# Altium schematic sheet Salve.SchDoc
size A; SheetNumber: 1; SheetTotal: 1
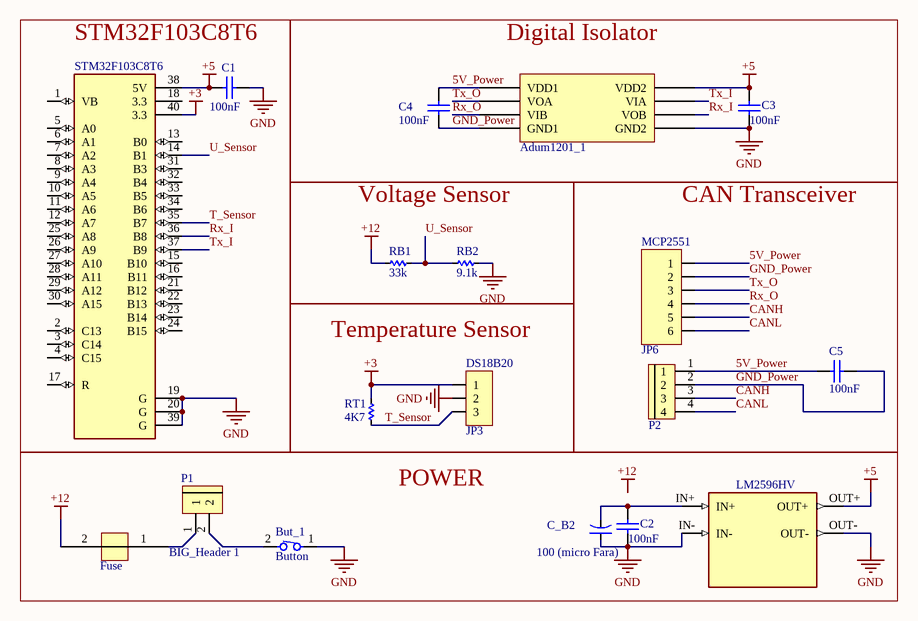
[diagram p0: Salve.SchDoc]

## Parts
*  Fuse  [fuse]
*1  Adum1201_1  [Adum1201]
But_1  Button  [Button]
C1  value 100nF  [Tu-ceramic]  (hidden comment: Capacitor Ceramic)
C2  value 100nF  [Tu-ceramic]  (hidden comment: Capacitor Ceramic)
C3  value 100nF  [Tu-ceramic]  (hidden comment: Capacitor Ceramic)
C4  value 100nF  [Tu-ceramic]  (hidden comment: Capacitor Ceramic)
C5  value 100nF  [Tu-ceramic]  (hidden comment: Capacitor Ceramic)
C_B2  100 (micro Fara)  [CA-ALU-2.54]
DS18B20  JP3  [JP3-C1T]
MCP2551  JP6  [JP6-C1T]
P1  BIG_Header 1  [BIG_Header 2]
P2  BIG Header 4  [BIG_Header 4]  (value not drawn)
PS1  LM2596HV  [CONV_MC00100]
RB1  33k  [RES-1/2W]
RB2  9.1k  [RES-1/2W]
RT1  4K7  [RES-1/2W]
STM32F103C8T6  ZC323000  [MODULE_ZC323000]  (value not drawn)

## Blocks framed on the sheet
STM32F103C8T6: C1 STM32F103C8T6
Digital Isolator: *1 C3 C4
Voltage Sensor: RB1 RB2
CAN Transceiver: C5 MCP2551 P2
Temperature Sensor: DS18B20 RT1
POWER: * But_1 C2 C_B2 P1 PS1

## Nets
+3: DS18B20.1 RT1.1 STM32F103C8T6.40(3.3)
+5: *1.5(VDD2) C1.1 C3.1 PS1.OUT+ STM32F103C8T6.38(5V)
+12: *.2 RB1.2
GND: *1.8(GND2) But_1.1 C1.2 C2.2 C3.2 C_B2.1 DS18B20.2 PS1.IN- PS1.OUT- RB2.1 STM32F103C8T6.19(G) STM32F103C8T6.20(G) STM32F103C8T6.39(G)
5V_Power: *1.1(VDD1) C4.1 C5.1 MCP2551.1 P2.1
CANH: MCP2551.5 P2.3
CANL: MCP2551.6 P2.4
GND_Power: *1.4(GND1) C4.2 C5.2 MCP2551.2 P2.2
Rx_I: *1.7(VOB) STM32F103C8T6.36(B8)
Rx_O: *1.3(VIB) MCP2551.4
T_Sensor: DS18B20.3 RT1.2 STM32F103C8T6.35(B7)
Tx_I: *1.6(VIA) STM32F103C8T6.37(B9)
Tx_O: *1.2(VOA) MCP2551.3
U_Sensor: RB1.1 RB2.2 STM32F103C8T6.14(B1)
Net*_1: *.1 P1.1
NetBut_1_2: But_1.2 P1.2
NetC2_1: C2.1 C_B2.2 PS1.IN+

Not connected (* = marked no-connect by the designer): STM32F103C8T6 1(VB) 2(C13) 3(C14) 4(C15) 5(A0) 6(A1) 7(A2) 8(A3) 9(A4) 10(A5) 11(A6) 12(A7) 13(B0) 15(B10) 16(B11) 17(R) 18(3.3) 21(B12) 22(B13) 23(B14) 24(B15) 25(A8) 26(A9) 27(A10) 28(A11) 29(A12) 30(A15) 31(B3) 32(B4) 33(B5) 34(B6)

## Notes on the sheet
- Labels drawn without touching a wire or pin: +12

## Library data of the parts
* = Component_1
*1 = Adum1201_?
C1-C5 = CapDecop: Capacitor; Published: 8-Jun-2000; LatestRevisionDate: 17-Jul-2002; LatestRevisionNote: Re-released for DXP Platform.; PackageReference: RAD-0.3; Publisher: Altium Limited
C_B2 = CN-ALU-DIP: Capacitor (Semiconductor SIM Model); Value: 104; LatestRevisionDate: 17-Jul-2002; LatestRevisionNote: Re-released for DXP Platform.; PackageReference: C1206; Publisher: Altium Limited
DS18B20 = JP3: WR-PHD 2.54 mm Angled Socket Header; Manufacturer: W¨¹rth Elektronik eiSos GmbH; partNo: 613003143121; ComponentLink1 Description: Manufacturer; ComponentLink2 Description: Datasheet; NoPins: 03; Created Date: 29 March 2013; ComponentLink1URL: http://www.we-online.com; ComponentLink2URL: http://katalog.we-online.de/em/datasheet/6130xx143121.pdf; Created by: Karrer Zheng
MCP2551 = JP6: WR-PHD 2.54 mm Angled Socket Header; Manufacturer: W¨¹rth Elektronik eiSos GmbH; partNo: 613006143121; ComponentLink1 Description: Manufacturer; ComponentLink2 Description: Datasheet; NoPins: 06; Created Date: 29 March 2013; ComponentLink1URL: http://www.we-online.com; ComponentLink2URL: http://katalog.we-online.de/em/datasheet/6130xx143121.pdf; Created by: Karrer Zheng
P1 = BIG_Header 2
P2 = BIG_Header 4
PS1 = MC00100: DC-DC LM2596 Step Down Adjustable Converter Power Supply Module 1.3V-35V; MF: YKS; SnapEDA_Link: https://www.snapeda.com/parts/MC00100/YKS/view-part/?ref=snap; Package: None; Value: *; MP: MC00100; Check_prices: https://www.snapeda.com/parts/MC00100/YKS/view-part/?ref=eda
RB1 RB2 RT1 = Res: Manufacturer: Generic Components; Class: Passive; SubClass: R; Published: 08/06/2000; Publisher: Altium Hobart Technology Centre
STM32F103C8T6 = ZC323000: STM32F103C8T6 ARM STM32 Minimum System Development Board Module For Arduino; Package: None; MP: ZC323000; Value: *; Availability: Unavailable; Price: None